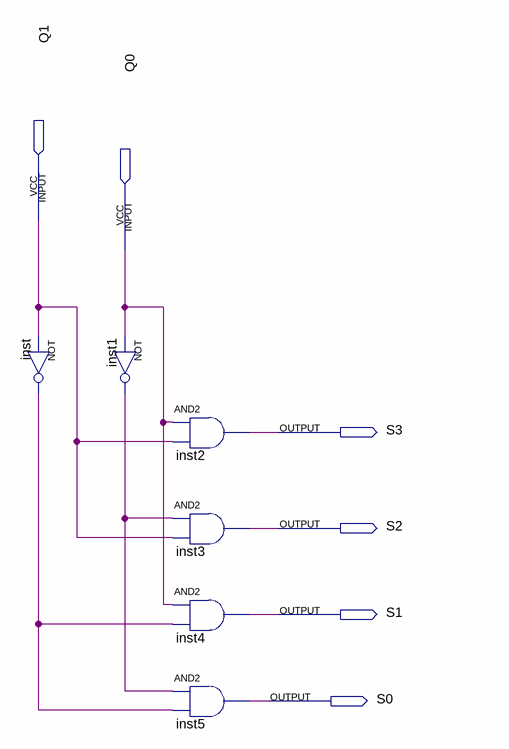
[diagram p0: schematic sheet]
// Quartus schematic decoder_state.bdf as structural Verilog: 6 symbols, 6 pins
module decoder_state (
  input  Q1,
  input  Q0,
  output S3,
  output S2,
  output S1,
  output S0
);

  wire inst1_out, inst_out;

  not inst (inst_out, Q1);
  not inst1 (inst1_out, Q0);
  and inst2 (S3, Q0, Q1);
  and inst3 (S2, inst1_out, Q1);
  and inst4 (S1, Q0, inst_out);
  and inst5 (S0, inst1_out, inst_out);
endmodule
